# Altium schematic sheet switchStart.SchDoc
size A4; SheetNumber: 12; SheetTotal: 15
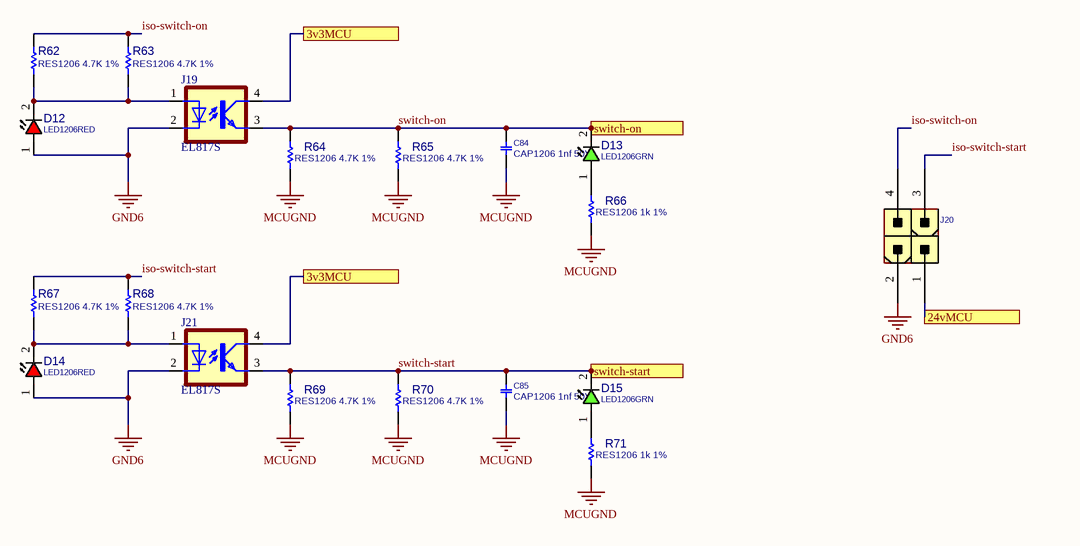
[diagram p0: switchStart.SchDoc]

## Parts
C84  CAP1206 1nf 50V  [C1206]
C85  CAP1206 1nf 50V  [C1206]
D12  LED1206RED  [LED1206RED]
D13  LED1206GRN  [LED1206GRN]
D14  LED1206RED  [LED1206RED]
D15  LED1206GRN  [LED1206GRN]
J19  EL817S  [SOIC254P1030X460-4N]
J20  CONN_ATXPWR_4  [ATXPWR_4]  (value not drawn)
J21  EL817S  [SOIC254P1030X460-4N]
R62  RES1206 4.7K 1%  [R1206]
R63  RES1206 4.7K 1%  [R1206]
R64  RES1206 4.7K 1%  [R1206]
R65  RES1206 4.7K 1%  [R1206]
R66  RES1206 1k 1%  [R1206]
R67  RES1206 4.7K 1%  [R1206]
R68  RES1206 4.7K 1%  [R1206]
R69  RES1206 4.7K 1%  [R1206]
R70  RES1206 4.7K 1%  [R1206]
R71  RES1206 1k 1%  [R1206]

## Ports
3v3MCU, 24vMCU, switch-on, switch-start

## Nets
GND6: D12.1(ANODE) D14.1(ANODE) J19.2(C) J20.2 J21.2(C)
MCUGND: C84.2 C85.2 R64.1 R65.1 R66.1 R69.1 R70.1 R71.1
3v3MCU: J19.4(COL) J21.4(COL) ; port 3v3MCU
24vMCU: J20.1 ; port 24vMCU
iso-switch-on: J20.4 R62.2 R63.2
iso-switch-start: J20.3 R67.2 R68.2
switch-on: C84.1 D13.2(CATHODE) J19.3(EMIT) R64.2 R65.2 ; port switch-on
switch-start: C85.1 D15.2(CATHODE) J21.3(EMIT) R69.2 R70.2 ; port switch-start
NetD12_2: D12.2(CATHODE) J19.1(A) R62.1 R63.1
NetD13_1: D13.1(ANODE) R66.2
NetD14_2: D14.2(CATHODE) J21.1(A) R67.1 R68.1
NetD15_1: D15.1(ANODE) R71.2

## Library data of the parts
C84 C85 = CAP_SMD_MLCC_1206: CAP, MLCC; PARAM: -, -%; MANF_P#: MANF_PART#; PARAM2: -V; PRICE: 100= 1$; MANF: -; ASSEMBLY: ASSEMBLY
D12 D14 = LED_SMD_1206_RED: LED, SMD, 1206, RED; DESC: DESCRIPTION; MANF_P#: MANF_PART#; PARAM2: 1.7~2.4V; MANF: MANF; ASSEMBLY: ASSEMBLY; PRICE: 36t@Javan; VALUE: LED1206RED; MountType: SMT; PartType: LED
D13 D15 = LED_SMD_1206_GRN: LED, SMD, 1206, GREEN; PARAM: 20mA; DESC: DESCRIPTION; PARAM2: 2.2V; MANF: -; ASSEMBLY: ASSEMBLY; PRICE: 36t@Javan; MANF_P#: -; VALUE: LED1206GRN; MountType: SMT; PartType: LED
J19 J21 = EL817S: Optoisolator Transistor Output 5000Vrms 1 Channel 4-SMD; MF: Everlight Electronics; SnapEDA_Link: https://www.snapeda.com/parts/EL817S/Everlight+Electronics+Co+Ltd/view-part/?ref=snap; Package: SMD-4 Everlight Electronics Co Ltd; Value: *; MP: EL817S; Check_prices: https://www.snapeda.com/parts/EL817S/Everlight+Electronics+Co+Ltd/view-part/?ref=eda
J20 = CONN_ATXPWR_4: CONN, ATX POWER, 4 P; MANF: TE, Molex; MANF_P#: 4-1775099-0, 39281043; VALUE: CONN_ATXPWR_4; MountType: THD; PACKAGE: ATXPWR-4pin; Part Type: Conn.
R62-R71 = RES_SMD_1206: RESISTOR, SMD; PARAM: 1%, 0.25W; DESC: DESCRIPTION; DIST#: MOUSER; MANF_P#: -; MANF: -; ASSEMBLY: ASSEMBLY; PRICE: -; PARAM2: -